# Altium schematic sheet SMPS_POWER.SchDoc
size A3; SheetNumber: 2; SheetTotal: 7
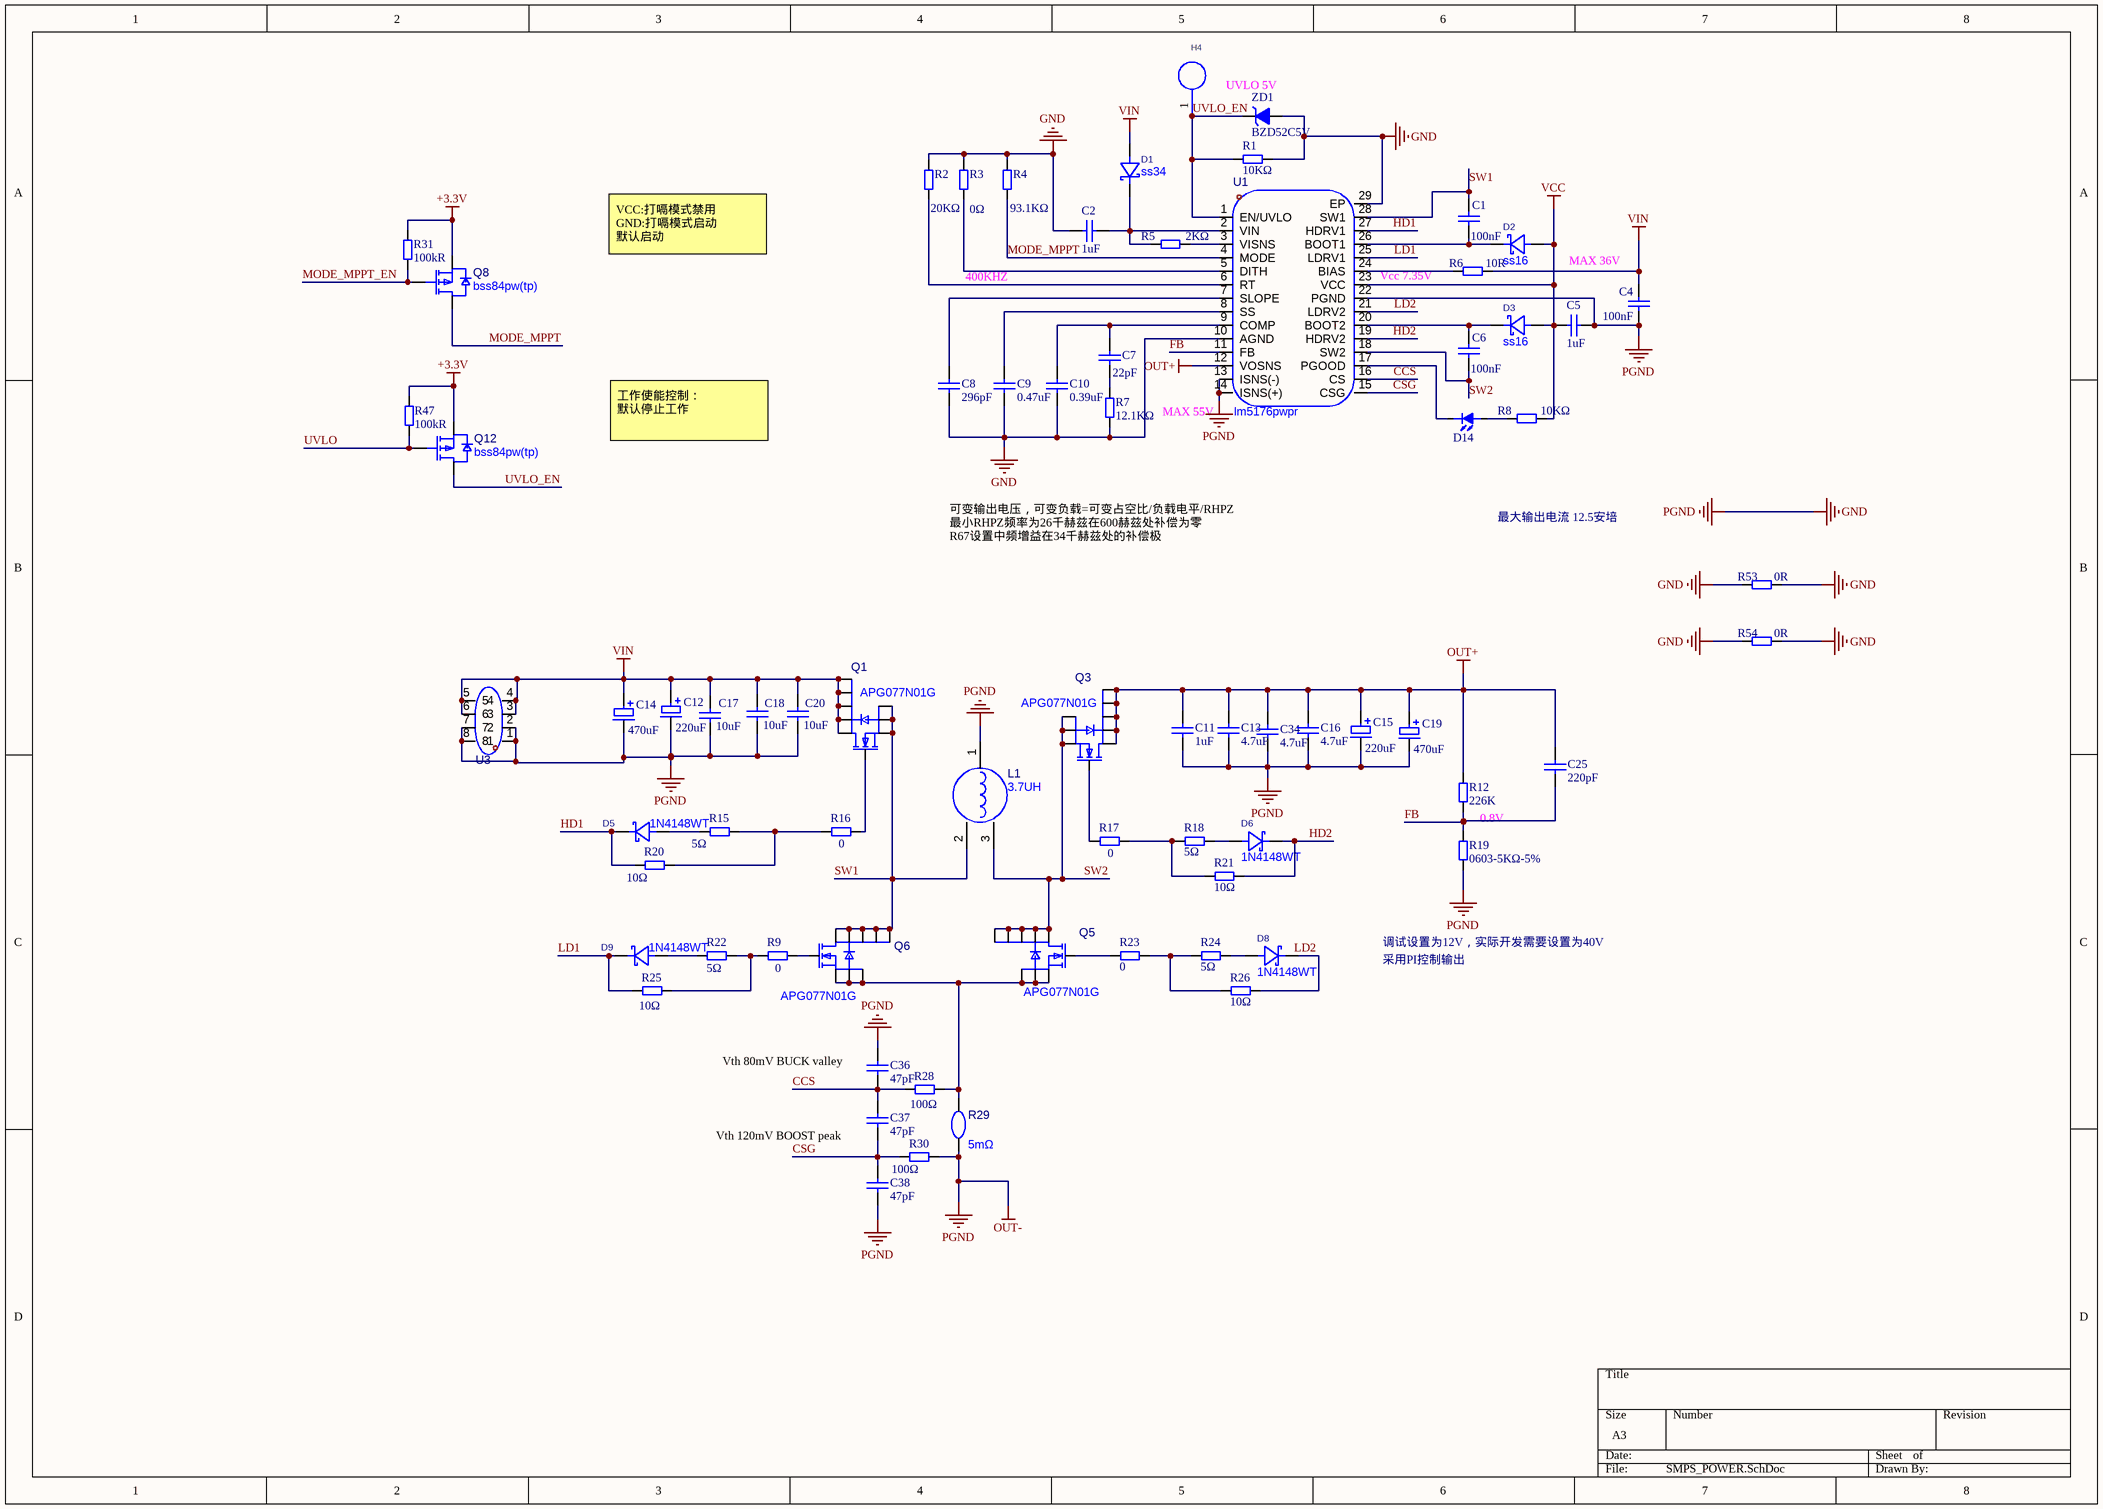
[diagram p0: SMPS_POWER.SchDoc]

## Parts
C1  100nF  [C0603]
C2  1uF  [C0603]
C4  100nF  [C0603]
C5  1uF  [C0603]
C6  100nF  [C0603]
C7  22pF  [C0603]
C8  296pF  [C0603]
C9  0.47uF  [C0603]
C10  0.39uF  [C0603]
C11  1uF  [C0805]
C12  220uF  [CAP-TH_BD8.0-P3.50-D0.5-FD]
C13  4.7uF  [C0805]
C14  470uF  [CAP-TH_BD8.0-P3.50-D0.5-FD]
C15  220uF  [CAP-TH_BD8.0-P3.50-D0.5-FD]
C16  4.7uF  [C0805]
C17  10uF  [C0805]
C18  10uF  [C0805]
C19  470uF  [CAP-TH_BD8.0-P3.50-D0.5-FD]
C20  10uF  [C0805]
C25  220pF  [C0603]
C34  4.7uF  [C0805]
C36  47pF  [C0603]
C37  47pF  [C0603]
C38  47pF  [C0603]
D1  ss34  [SMA_L4.3-W2.6-LS5.0-FD]
D2  ss16  [SMA_L4.3-W2.6-LS5.0-FD]
D3  ss16  [SMA_L4.3-W2.6-LS5.0-FD]
D5  1N4148WT  [SOD-523_L1.2-W0.8-LS1.6-FD]
D6  1N4148WT  [SOD-523_L1.2-W0.8-LS1.6-FD]
D8  1N4148WT  [SOD-523_L1.2-W0.8-LS1.6-FD]
D9  1N4148WT  [SOD-523_L1.2-W0.8-LS1.6-FD]
D14  DIO_LED  [LED0603-RD_RED]  (value not drawn)
H4  PZ254V-11-01P  [HDR-TH_1P-P2.54-V-M]  (value not drawn)
L1  3.7UH  [IND-SMD_3P-L15.5-W15.5-L]
Q1  APG077N01G  [PDFN-8_L5.8-W5.1-P1.27-LS6.1-BL]
Q3  APG077N01G  [PDFN-8_L5.8-W5.1-P1.27-LS6.1-BL]
Q5  APG077N01G  [PDFN-8_L5.8-W5.1-P1.27-LS6.1-BL]
Q6  APG077N01G  [PDFN-8_L5.8-W5.1-P1.27-LS6.1-BL]
Q8  bss84pw(tp)  [SOT-323-3_L2.0-W1.3-P1.30-LS2.1-BR]
Q12  bss84pw(tp)  [SOT-323-3_L2.0-W1.3-P1.30-LS2.1-BR]
R1  10KΩ  [R0603]
R2  20KΩ  [R0603]
R3  0Ω  [R0603]
R4  93.1KΩ  [R0603]
R5  2KΩ  [R0603]
R6  10R  [R0603]
R7  12.1KΩ  [R0603]
R8  10KΩ  [R0603]
R9  0  [R0603]
R12  226K  [R0603]
R15  5Ω  [R0603]
R16  0  [R0603]
R17  0  [R0603]
R18  5Ω  [R0603]
R19  0603-5KΩ-5%  [R0603]
R20  10Ω  [R0603]
R21  10Ω  [R0603]
R22  5Ω  [R0603]
R23  0  [R0603]
R24  5Ω  [R0603]
R25  10Ω  [R0603]
R26  10Ω  [R0603]
R28  100Ω  [R0603]
R29  5mΩ  [RES-SMD_L6.4-W3.2-1]
R30  100Ω  [R0603]
R31  100kR  [R0603]
R47  100kR  [R0603]
R53  0R  [R0603]
R54  0R  [R0603]
U1  lm5176pwpr  [HTSSOP-28_L9.7-W4.4-P0.65-LS6.4-BL-EP]
U3  c4201wr-2x4p_c5333418  [CONN-TH_8P-P4.20_CJT_C4201WR-2X4P]  (value not drawn)
ZD1  BZD52C5V  [SOD-123_L2.7-W1.6-LS3.7-RD]

## Nets
+3.3V: Q8.2(S) Q12.2(S) R31.1 R47.1
GND: C2.1 C4.1 C5.1 C8.1 C9.1 C10.1 C11.1 C12.2 C13.1 C14.2 C15.2 C16.1 C17.1 C18.1 C19.2 C20.1 C34.1 C36.2 C38.1 L1.1 R1.2 R2.2 R3.2 R4.2 R7.1 R19.1 R29.1 R30.1 R53.1 R53.2 R54.1 R54.2 U1.10(AGND) U1.13(ISNS(-)) U1.14(ISNS(+)) U1.22(PGND) U1.29(EP) U3.1 U3.2 U3.7 U3.8 ZD1.2  [also labelled OUT-, PGND]
OUT+: C11.2 C13.2 C15.1 C16.2 C19.1 C25.2 C34.2 Q3.5(D) Q3.6(D) Q3.7(D) Q3.8(D) Q3.9(D) R12.2 U1.12(VOSNS)
VCC: C5.2 D2.1(A) D3.1(A) R8.2 U1.23(VCC)
VIN: C4.2 C12.1 C14.1 C17.2 C18.2 C20.2 D1.1(A) Q1.5(D) Q1.6(D) Q1.7(D) Q1.8(D) Q1.9(D) R6.2 U3.3 U3.4 U3.5 U3.6
CCS: C36.1 C37.2 R28.2 U1.16(CS)
CSG: C37.1 C38.2 R30.2 U1.15(CSG)
FB: C25.1 R12.1 R19.2 U1.11(FB)
HD1: D5.2(K) R20.2 U1.27(HDRV1)
HD2: D6.2(K) R21.2 U1.19(HDRV2)
LD1: D9.2(K) R25.2 U1.25(LDRV1)
LD2: D8.2(K) R26.2 U1.21(LDRV2)
MODE_MPPT: Q8.3(D) R4.1 U1.4(MODE)
MODE_MPPT_EN: Q8.1(G) R31.2
SW1: C1.2 L1.2 Q1.1(S) Q1.2(S) Q1.3(S) Q6.5(D) Q6.6(D) Q6.7(D) Q6.8(D) Q6.9(D) U1.28(SW1)
SW2: C6.1 L1.3 Q3.1(S) Q3.2(S) Q3.3(S) Q5.5(D) Q5.6(D) Q5.7(D) Q5.8(D) Q5.9(D) U1.18(SW2)
UVLO: Q12.1(G) R47.2
UVLO_EN: H4.1 Q12.3(D) R1.1 U1.1(EN/UVLO) ZD1.1
NetC1_1: C1.1 D2.2(K) U1.26(BOOT1)
NetC2_2: C2.2 D1.2(K) R5.1 U1.2(VIN)
NetC6_2: C6.2 D3.2(K) U1.20(BOOT2)
NetC7_1: C7.1 R7.2
NetC7_2: C7.2 C10.2 U1.9(COMP)
NetC8_2: C8.2 U1.7(SLOPE)
NetC9_2: C9.2 U1.8(SS)
NetD5_1: D5.1(A) R15.2
NetD6_1: D6.1(A) R18.2
NetD8_1: D8.1(A) R24.2
NetD9_1: D9.1(A) R22.2
NetD14_1: D14.1 U1.17(PGOOD)
NetD14_2: D14.2 R8.1
NetQ1_4: Q1.4(G) R16.1
NetQ3_4: Q3.4(G) R17.2
NetQ5_1: Q5.1(S) Q5.2(S) Q5.3(S) Q6.1(S) Q6.2(S) Q6.3(S) R28.1 R29.2
NetQ5_4: Q5.4(G) R23.2
NetQ6_4: Q6.4(G) R9.1
NetR2_1: R2.1 U1.6(RT)
NetR3_1: R3.1 U1.5(DITH)
NetR5_2: R5.2 U1.3(VISNS)
NetR6_1: R6.1 U1.24(BIAS)
NetR9_2: R9.2 R22.1 R25.1
NetR15_1: R15.1 R16.2 R20.1
NetR17_1: R17.1 R18.1 R21.1
NetR23_1: R23.1 R24.1 R26.1

## Notes on the sheet
- UVLO 5V
- VCC:打嗝模式禁用
  GND:打嗝模式启动
  默认启动
- 400KHZ
- Vcc 7.35V
- MAX 36V
- 工作使能控制：
  默认停止工作
- (near U1) MAX 55V
- 最大输出电流 12.5安培
- 可变输出电压，可变负载=可变占空比/负载电平/RHPZ
  最小RHPZ频率为26千赫兹在600赫兹处补偿为零
  R67设置中频增益在34千赫兹处的补偿极
- 0.8V
- 调试设置为12V，实际开发需要设置为40V
- 采用PI控制输出
- (near C36) Vth 80mV BUCK valley
- Vth 120mV BOOST peak

## Library data of the parts
C1 C2 C4-C10 C25 C36-C38 = C0603: Capacitor; Value: 104; Published: 8-Jun-2000; LatestRevisionDate: 17-Jul-2002; LatestRevisionNote: Re-released for DXP Platform.; Publisher: Altium Limited
C11 C13 C16-C18 C20 C34 = C0805: Capacitor; Value: 104; Published: 8-Jun-2000; LatestRevisionDate: 17-Jul-2002; LatestRevisionNote: Re-released for DXP Platform.; Publisher: Altium Limited
C12 C14 C15 C19 = CAP_EC_1: 贴片铝电解电容（RVT1V101M0607）; Part Number: *; Brand: *
D1 = ss34_c7420365: 二极管配置:独立式;正向压降(Vf):550mV@3A;直流反向耐压(Vr):40V;整流电流:3A;; Manufacturer: R+O(宏嘉诚); AddInBom: yes; ModelId: 7e24bebe6cd74171ae8c9de6fc5b78aa; ModelTransform: 198.4248,103.5431,0,180,0,0,-0.001,0,0; Diode Configuration: 独立式; Voltage - DC Reverse(Vr): 40V; Current - Rectified: 3A; Reverse Leakage Current (Ir): 200uA@40V; Symbol: SS34_C7420365; LCSC Part Name: 电压:40V 电流:3A; SupplierPart: C7420365; ManufacturerPart: SS34; Supplier Footprint: SMA(DO-214AC); JLCPCB Part Class: Extended Part; Datasheet: https://item.szlcsc.com/datasheet/SS34/8397187.html; Supplier: LCSC; ConvertToPcb: yes; FootprintName: SMA_L4.3-W2.6-LS5.0-FD; ModelName: SMA_L4.3-W2.6-LS5.0-FD; Voltage - Forward(Vf@If): 550mV@3A
D2 D3 = ss34_c7420365: 二极管配置:独立式;正向压降(Vf):550mV@3A;直流反向耐压(Vr):40V;整流电流:3A;; Manufacturer: R+O(宏嘉诚); ManufacturerPart: SS34; AddInBom: yes; ModelId: 7e24bebe6cd74171ae8c9de6fc5b78aa; ModelTransform: 198.4248,103.5431,0,180,0,0,-0.001,0,0; Diode Configuration: 独立式; Voltage - DC Reverse(Vr): 40V; Current - Rectified: 3A; Reverse Leakage Current (Ir): 200uA@40V; Symbol: SS34_C7420365; LCSC Part Name: 电压:40V 电流:3A; SupplierPart: C7420365; Supplier Footprint: SMA(DO-214AC); JLCPCB Part Class: Extended Part; Datasheet: https://item.szlcsc.com/datasheet/SS34/8397187.html; Supplier: LCSC; ConvertToPcb: yes; FootprintName: SMA_L4.3-W2.6-LS5.0-FD; ModelName: SMA_L4.3-W2.6-LS5.0-FD; Voltage - Forward(Vf@If): 550mV@3A
D5 D6 D8 D9 = 1N4148WT: 二极管配置:独立式;整流电流:150mA;直流反向耐压(Vr):100V;正向压降(Vf):1.25V@150mA;反向恢复时间(Trr):4ns;; Manufacturer: R+O(宏嘉诚); Symbol: 1N4148WT_C7420320; AddInBom: yes; ModelId: 8f56a03db567494d8f4c9d12aa52a741; ModelName: SOD-523_L1.2-W0.8-H0.7-LS1.6; ModelTransform: 62.992,31.496,0,0,0,0,0,0,0; Diode Configuration: 独立式; Pd - Power Dissipation: 150mW; Current - Rectified: 150mA; Voltage - DC Reverse(Vr): 100V; Non-Repetitive Peak Forward Surge Current: 2A; Reverse Leakage Current (Ir): 1uA@75V; Reverse Recovery Time (trr): 4ns; Operating Junction Temperature Range: -55℃~+150℃; LCSC Part Name: 100V 150mA; SupplierPart: C7420320; ManufacturerPart: 1N4148WT; Supplier Footprint: SOD-523; JLCPCB Part Class: Extended Part; Datasheet: https://item.szlcsc.com/datasheet/1N4148WT/8397142.html; Supplier: LCSC; ConvertToPcb: yes; FootprintName: SOD-523_L1.2-W0.8-LS1.6-FD; Voltage - Forward(Vf@If): 1.25V@150mA
D14 = DIO_LED: Brand: LED; Part Number: *
H4 = PZ254V-11-01P: Manufacturer: XFCN(兴飞); Add into BOM: yes; Pin Structure: 1x1P; Pitch: 2.54mm; Circluar Pins/Square Pins: 方针; Symbol: PZ254V-11-01P; Device: PZ254V-11-01P; LCSC Part Name: 1x1P 间距:2.54mm 方针 直插; Supplier Part: C492400; Manufacturer Part: PZ254V-11-01P; Supplier Footprint: 插件,P=2.54mm; JLCPCB Part Class: Extended Part; Datasheet: https://atta.szlcsc.com/upload/public/pdf/source/20200309/C492400_46876A5B545F5AE6B8D4A09C46E276E8.pdf; Supplier: LCSC; Convert to PCB: yes; Row Spacing: -; Mounting Type: 直插; Number of Rows: 单排; Number of Pins: 1P; Current Rating: -; Voltage Rating (Max): -; Length of Mating Pin: 6mm; Insulation Height: 2.5mm; Length of End Connection Pin: 3mm; Contact Material: 黄铜; Contact Plating: -; Operating Temperature: -40℃~+105℃; Color: 黑色
L1 = cdep15d90t150np-4r7mc-125: 适用于高耐压(直流120V)和大电流。磁屏蔽。符合AEC Q200标准。工作温度范围:-40°C至+150°C(包括线圈自身温升); Manufacturer: Sumida(胜美达); AddInBom: yes; ModelId: 109db49b485b4137a89608c2501f93a1; ModelName: IND-SMD_3P-L15.5-W15.5-H10.0-L; ModelTransform: 611.022,610.235,0,180,0,0,0,0,0; Value: 4.7uH; Tolerance: ±20%; Rated Current: 16.5A; Saturation Current (Isat): 21.3A; DC Resistance (DCR): 3.5mΩ; Symbol: CDEP15D90T150NP-4R7MC-125; LCSC Part Name: 4.7uH ±20% 21.3A; SupplierPart: C171579; ManufacturerPart: CDEP15D90T150NP-4R7MC-125; Supplier Footprint: SMD-3P,15.5x15.5mm; JLCPCB Part Class: Extended Part; Datasheet: https://atta.szlcsc.com/upload/public/pdf/source/20180612/C171581_D70A455BA7744A0B5218E235967B6B52.pdf; Supplier: LCSC; ConvertToPcb: yes; FootprintName: IND-SMD_3P-L15.5-W15.5-L; Ratings: AEC-Q200
Q1 Q3 Q5 Q6 = apg077n01g: 数量:-;漏源电压(Vdss):100V;连续漏极电流(Id):90A;导通电阻(RDS(on)):7.7mΩ@10V;耗散功率(Pd):105W;阈值电压(Vgs(th)):3V@250uA;; Manufacturer: ALLPOWER(铨力); AddInBom: yes; ModelId: 178189b27e7544aca50c111426555358; ModelName: PDFN-8_L4.9-W5.8-H1.0-P1.27; ModelTransform: 200.787,240.157,0,0,0,0,0,0,0; Drain to Source Voltage: 100V; Current - Continuous Drain(Id): 90A; Pd - Power Dissipation: 105W; Gate Charge(Qg): 30nC@10V; Input Capacitance(Ciss): 3nF; Reverse Transfer Capacitance (Crss@Vds): 11pF; Type: N沟道; Output Capacitance(Coss): 362pF; Symbol: APG077N01G; LCSC Part Name: N沟道,电流:90A,耐压:100V; SupplierPart: C2840980; ManufacturerPart: APG077N01G; Supplier Footprint: PDFN-8(5x6); JLCPCB Part Class: Extended Part; Datasheet: https://item.szlcsc.com/datasheet/APG077N01G/3021876.html; Supplier: LCSC; ConvertToPcb: yes; FootprintName: PDFN-8_L5.8-W5.1-P1.27-LS6.1-BL; Number: -; RDS(on): 7.7mΩ@10V; Gate Threshold Voltage (Vgs(th)): 3V@250uA; Operating Temperature: -55℃~+150℃
Q8 Q12 = bss84pw(tp): 数量:1个P沟道;漏源电压(Vdss):50V;连续漏极电流(Id):-;导通电阻(RDS(on)):6Ω@5V;耗散功率(Pd):200mW;阈值电压(Vgs(th)):1.6V;; Manufacturer: TECH PUBLIC(台舟); AddInBom: yes; ModelId: 59529c0d6fc749f28f2d0659e12986b4; ModelName: SOT-323-3_L2.0-W1.3-H1.0-LS2.1-P1.30; ModelTransform: 78.74,82.677,0,90,0,0,0.0005,0,0; Number: 1个P沟道; Drain to Source Voltage: 50V; RDS(on): 6Ω@5V; Pd - Power Dissipation: 200mW; Gate Threshold Voltage (Vgs(th)): 1.6V; Input Capacitance(Ciss): 45pF; Reverse Transfer Capacitance (Crss@Vds): 12pF; Type: P沟道; Output Capacitance(Coss): 25pF; Vgs: ±20V; Symbol: BSS84PW(TP); LCSC Part Name: BSS84PW(TP); SupplierPart: C53340809; ManufacturerPart: BSS84PW(TP); Supplier Footprint: SOT-323; JLCPCB Part Class: Extended Part; Datasheet: https://item.szlcsc.com/datasheet/BSS84PW(TP)/56444021.html; Supplier: LCSC; ConvertToPcb: yes; FootprintName: SOT-323-3_L2.0-W1.3-P1.30-LS2.1-BR; Current - Continuous Drain(Id): -; Gate Charge(Qg): -; Operating Temperature: -55℃~+150℃; Configuration: -
R1-R9 R15-R18 R20-R26 R28 R30 R31 R47 R53 R54 = 0603-3KΩ-5%: 片式电阻; 物料描述: 片式电阻器-0805-10KΩ-5%-JT; 物料号: NA
R12 R19 = 0603-1KΩ-5%: 片式电阻; 物料描述: 片式电阻器-0805-10KΩ-5%-JT; 物料号: NA
R29 = hollr2512-3w-2mr-1%: 电阻类型:采样电阻;阻值:2mΩ;精度:±1%;额定压降:-;功率:3W;温度系数:±50ppm/℃;安装方式:贴片;; Manufacturer: Milliohm(毫欧); AddInBom: yes; ModelId: 2a92684014bd46c593e4aa7ce823c350; ModelTransform: 251.968,125.984,0,0,0,0,0,0,0; Value: 2mΩ; Tolerance: ±1%; Power(Watts): 3W; Rated Current: 77.5A; Mounting Sytle: 贴片; Symbol: HOLLR2512-3W-2MR-1%; LCSC Part Name: 2mΩ ±1% 3W; SupplierPart: C2994640; ManufacturerPart: HoLLR2512-3W-2mR-1%; Supplier Footprint: 2512; JLCPCB Part Class: Extended Part; Datasheet: https://atta.szlcsc.com/upload/public/pdf/source/20220330/9E8D3880B1628B3B70C68092C8A7E08B.pdf; Supplier: LCSC; ConvertToPcb: yes; FootprintName: RES-SMD_L6.4-W3.2-1; ModelName: RES-SMD_L6.4-W3.2-1; Type: 采样电阻; Rated Output Voltage: -; Temperature Coefficient: ±50ppm/℃
U1 = lm5176pwpr: 功能类型:升降压型;工作电压:4.2V~55V;输出电压:800mV~55V;输出电流:2A;输出类型:可调;; Manufacturer: TI(德州仪器); AddInBom: yes; ModelId: c33b2f64442f42ecb27b91aed85c9e5a; ModelTransform: 381.889,251.968,0,0,0,0,0,0,0; Function: 升降压型; Output Current: 2A; Frequency - Switching: 600kHz; Synchronous Rectifier: 是; Number of Outputs: 1; Topology: 降压式；升压式; Quiescent Current: 2mA; Switch tube (built-in/external): 外置; Output Type: 可调; Symbol: LM5176PWPR; LCSC Part Name: 升降压型 4.2V~55V; SupplierPart: C442493; ManufacturerPart: LM5176PWPR; Supplier Footprint: HTSSOP-28-EP; JLCPCB Part Class: Extended Part; Datasheet: https://www.ti.com/cn/lit/gpn/lm5176; Supplier: LCSC; ConvertToPcb: yes; FootprintName: HTSSOP-28_L9.7-W4.4-P0.65-LS6.4-BL-EP; ModelName: HTSSOP-28_L9.7-W4.4-P0.65-LS6.4-BL-EP; Voltage - Supply: 4.2V~55V; Output Voltage: 800mV~55V; Operating Temperature: -40℃~+125℃@(TJ); Features: 频率同步；逐波限流；可调软启动；过流保护；EMI优化(抖频模式)；打嗝限流
U3 = c4201wr-2x4p_c5333418: 插针结构:2x4P;间距:4.2mm;安装方式:弯插;总PIN数:8P;排数:2;每排PIN数:4;额定电流:13A;触头材质:黄铜;触头镀层:锡;工作温度:-40℃~+105℃;; Manufacturer: CJT(长江连接器); AddInBom: yes; ModelId: 4d4809cc7aa74aa0a0d297a6ab6683bc; ModelTransform: 709.0537,785.4315,0,0,0,0,-0.002,-261.811,-137.795; Pins Structure: 2x4P; Pitch: 4.2mm; Number of PINs Per Row: 4; Current Rating: 13A; Voltage Rating: 600V; Plastic Material: PA66; Flame Retardant Rating: UL94V-2; Z-Height of the Board: 9.6mm; Symbol: C4201WR-2X4P_C5333418; LCSC Part Name: 2x4P 间距:4.2mm 弯插; SupplierPart: C5333418; ManufacturerPart: C4201WR-2x4P; Supplier Footprint: 弯插,P=4.2mm; JLCPCB Part Class: Extended Part; Datasheet: https://item.szlcsc.com/datasheet/C4201WR-2x4P/6094518.html; Supplier: LCSC; ConvertToPcb: yes; FootprintName: CONN-TH_8P-P4.20_CJT_C4201WR-2X4P; ModelName: CONN-TH_8P-P4.20_CJT_C4201WR-2X4P; Mounting Type: 弯插; Number of Pins: 8P; Number of Rows: 2; Contact Material: 黄铜; Contact Plating: 锡; Operating Temperature: -40℃~+105℃; Color: 透明色
ZD1 = DIO_ZENER_3: 20V稳压管; Brand: 10V; Part Number: *